# Altium schematic sheet I2C Level Shifter.SchDoc
size 406 x 304 mm; SheetNumber: 6; SheetTotal: 8
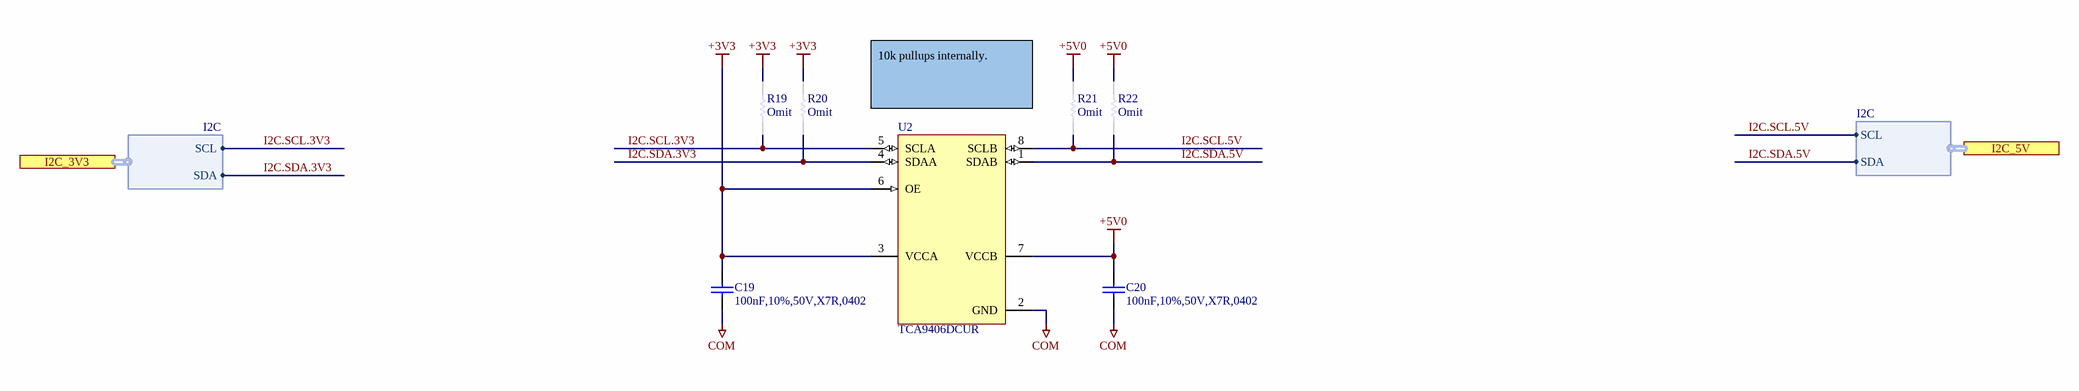
[diagram p0: I2C Level Shifter.SchDoc]

## Parts
C19  100nF,10%,50V,X7R,0402  [CAPC1005X06N]
C20  100nF,10%,50V,X7R,0402  [CAPC1005X06N]
R19  Omit  [RESC1005X04N]  (no BOM)
R20  Omit  [RESC1005X04N]  (no BOM)
R21  Omit  [RESC1005X04N]  (no BOM)
R22  Omit  [RESC1005X04N]  (no BOM)
U2  TCA9406DCUR  [TEXASINSTRUMENTS_PKG_DCU0008A]

## Ports
I2C_3V3 (harness I2C), I2C_5V (harness I2C)

## Harnesses
I2C: SCL, SDA

## Nets
+3V3: C19.2 R19.2 R20.2 U2.3(VCCA) U2.6(OE)
+5V0: C20.2 R21.2 R22.2 U2.7(VCCB)
COM: C19.1 C20.1 U2.2(GND)
I2C.SCL.3V3: R19.1 U2.5(SCLA) ; port I2C_3V3.SCL
I2C.SCL.5V: R21.1 U2.8(SCLB) ; port I2C_5V.SCL
I2C.SDA.3V3: R20.1 U2.4(SDAA) ; port I2C_3V3.SDA
I2C.SDA.5V: R22.1 U2.1(SDAB) ; port I2C_5V.SDA

## Notes on the sheet
- 10k pullups internally.
- Sheet Name:
- Date:
- Sheet
- Designer:
- of

## Library data of the parts
C19 C20 = CAP,Cer,100nF,10%,50V,X7R,0402: 50V 100nF X7R Â±10% 0402 Ceramic Capacitors ROHS; Manufacturer 1: Murata; Manufacturer 1 Part Number: GRM155R71H104KE14D; Vendor 1 Part Number: C77020; Vendor 1: LCSC; Value: 100n; Part Name: CAP,Cer,100nF,10%,50V,X7R,0402; CreatedBy: Judd Foster; HelpURL: https://www.lcsc.com/datasheet/C77020.pdf
R19-R22 = RES,Omit,0402: Part Name: RES,Omit,0402; CreatedBy: Judd Foster; HelpURL: N/A; Manufacturer 1: N/A; Manufacturer 1 Part Number: N/A; Vendor 1: N/A; Vendor 1 Part Number: N/A; Value: Omit
U2 = TCA9406DCUR: Voltage Level Translator Bidirectional 1 Circuit 2 Channel 24Mbps 8-VSSOP; Manufacturer 1: Texas Instruments; Vendor 1 Part Number: 296-28109-1-ND; Vendor 1: DigiKey; Part Name: TCA9406DCUR; CreatedBy: Judd Foster; HelpURL: https://www.ti.com/general/docs/suppproductinfo.tsp?distId=10&gotoUrl=https%3A%2F%2Fwww.ti.com%2Flit%2Fgpn%2Ftca9406; Manufacturer 1 Part Number: TCA9406DCUR